# Altium project Frame example.PrjPcb
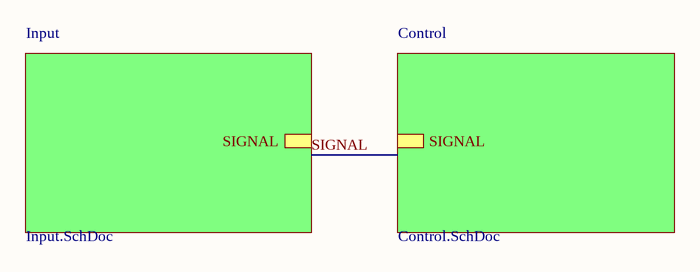
[diagram p0: Assembly.SchDoc]
3 sheets, 2 parts. Net scope: hierarchical (ports join the sheet entries above them; power ports are global).
Sheets:
  Assembly.SchDoc
    Input = Input.SchDoc
    Control = Control.SchDoc

## Sheet Assembly.SchDoc
size 173 x 110 mm

### Sub-sheets
Control = Control.SchDoc: SIGNAL
Input = Input.SchDoc: SIGNAL

## Sheet Input.SchDoc
size 76 x 45 mm
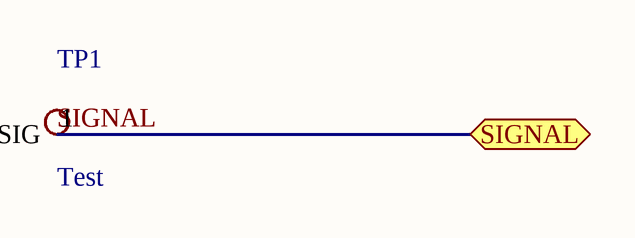
[diagram p1: Input.SchDoc]

### Parts
TP1  Test

### Ports
SIGNAL

### Nets
SIGNAL: TP1.1(SIG) ; port SIGNAL

### Library data of the parts
TP1 = Tap

## Sheet Control.SchDoc
size 50 x 19 mm
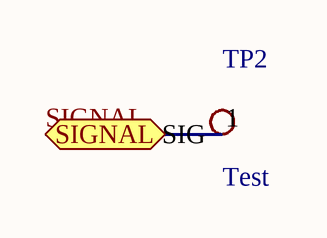
[diagram p2: Control.SchDoc]

### Parts
TP2  Test

### Ports
SIGNAL

### Nets
SIGNAL: TP2.1(SIG) ; port SIGNAL

### Library data of the parts
TP2 = Tap